# Altium schematic sheet USB_OTG_FS.SchDoc (part 1 of 3)
size A; SheetNumber: 9; SheetTotal: 18
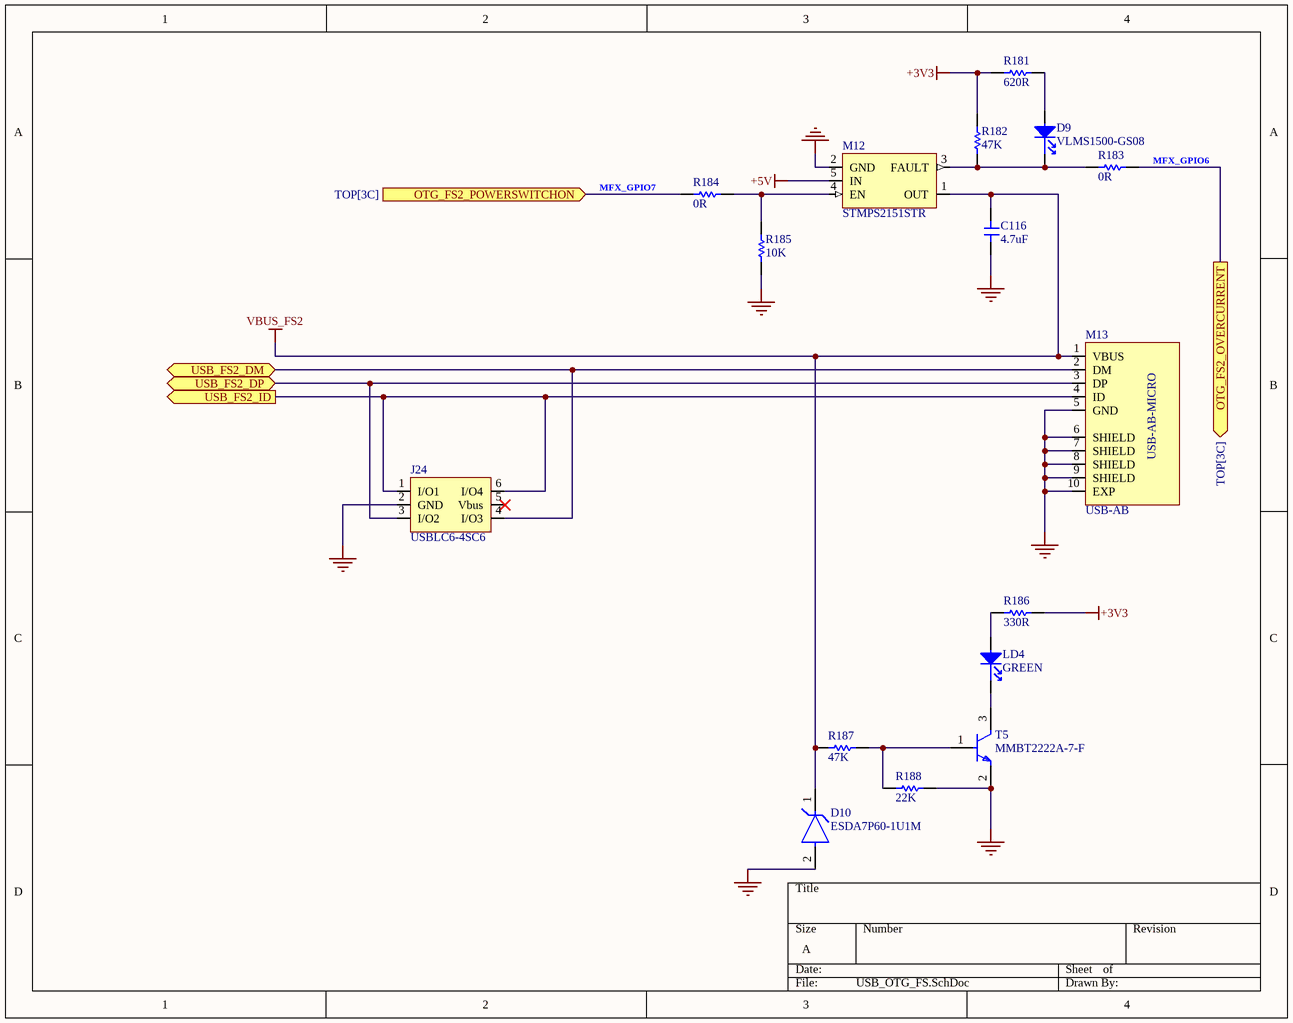
[diagram p0: USB_OTG_FS.SchDoc]

## Parts
C116  4.7uF  [FP-CC0402-IPC_C]
D9  VLMS1500-GS08  [LEDRED]
D10  ESDA7P60-1U1M  [FP-1610-MFG]
J24  USBLC6-4SC6  [SOT23-6L_STM]
LD4  GREEN  [LEDGREEN]
M12  STMPS2151STR  [FP-SOT23-5L-7049676-MFG]
M13  USB-AB  [CONN_1050170001_MOL]
R181  620R  [RESC1608X55X25NL10T15]
R182  47K  [RESC1608X55X25NL10T15]
R183  0R  [RESC1608X55X25NL10T15]
R184  0R  [RESC1608X55X25NL10T15]
R185  10K  [RESC1608X55X25NL10T15]
R186  330R  [RESC1608X55X25NL10T15]
R187  47K  [RESC1608X55X25NL10T15]
R188  22K  [RESC1608X55X25NL10T15]
T5  MMBT2222A-7-F  [FP-SOT23-MFG]

## Ports
OTG_FS2_OVERCURRENT (out, see TOP[3C]), OTG_FS2_POWERSWITCHON (in, see TOP[3C]), USB_FS2_DM (bidir, see TOP[4C], MCU_IO[1B]), USB_FS2_DP (bidir, see TOP[4C], MCU_IO[1B]), USB_FS2_ID (out, see TOP[4C], MCU_IO[2B])

## Nets
+3V3: R181.1 R182.1 R186.2
+5V: M12.5(IN)
GND: C116.2 D10.2(A) J24.2(GND) M12.2(GND) M13.5(GND) M13.6(SHIELD) M13.7(SHIELD) M13.8(SHIELD) M13.9(SHIELD) M13.10(EXP) R185.2 R188.2 T5.2(E)
VBUS_FS2: C116.1 D10.1(C) M12.1(OUT) M13.1(VBUS) R187.1
MFX_GPIO6: R183.2 ; port OTG_FS2_OVERCURRENT
MFX_GPIO7: R184.1 ; port OTG_FS2_POWERSWITCHON
USB_FS2_DM: J24.4(I/O3) M13.2(DM) ; port USB_FS2_DM
USB_FS2_DP: J24.3(I/O2) M13.3(DP) ; port USB_FS2_DP
USB_FS2_ID: J24.1(I/O1) J24.6(I/O4) M13.4(ID) ; port USB_FS2_ID
NetD9_1: D9.1 M12.3(FAULT) R182.2 R183.1
NetD9_2: D9.2 R181.2
NetLD4_1: LD4.1 T5.3(C)
NetLD4_2: LD4.2 R186.1
NetM12_4: M12.4(EN) R184.2 R185.1
NetR187_2: R187.2 R188.1 T5.1(B)

Not connected (* = marked no-connect by the designer): J24 5(Vbus)*